# Altium schematic sheet 01_Alimentacion.SchDoc
size A; SheetNumber: 1; SheetTotal: 4
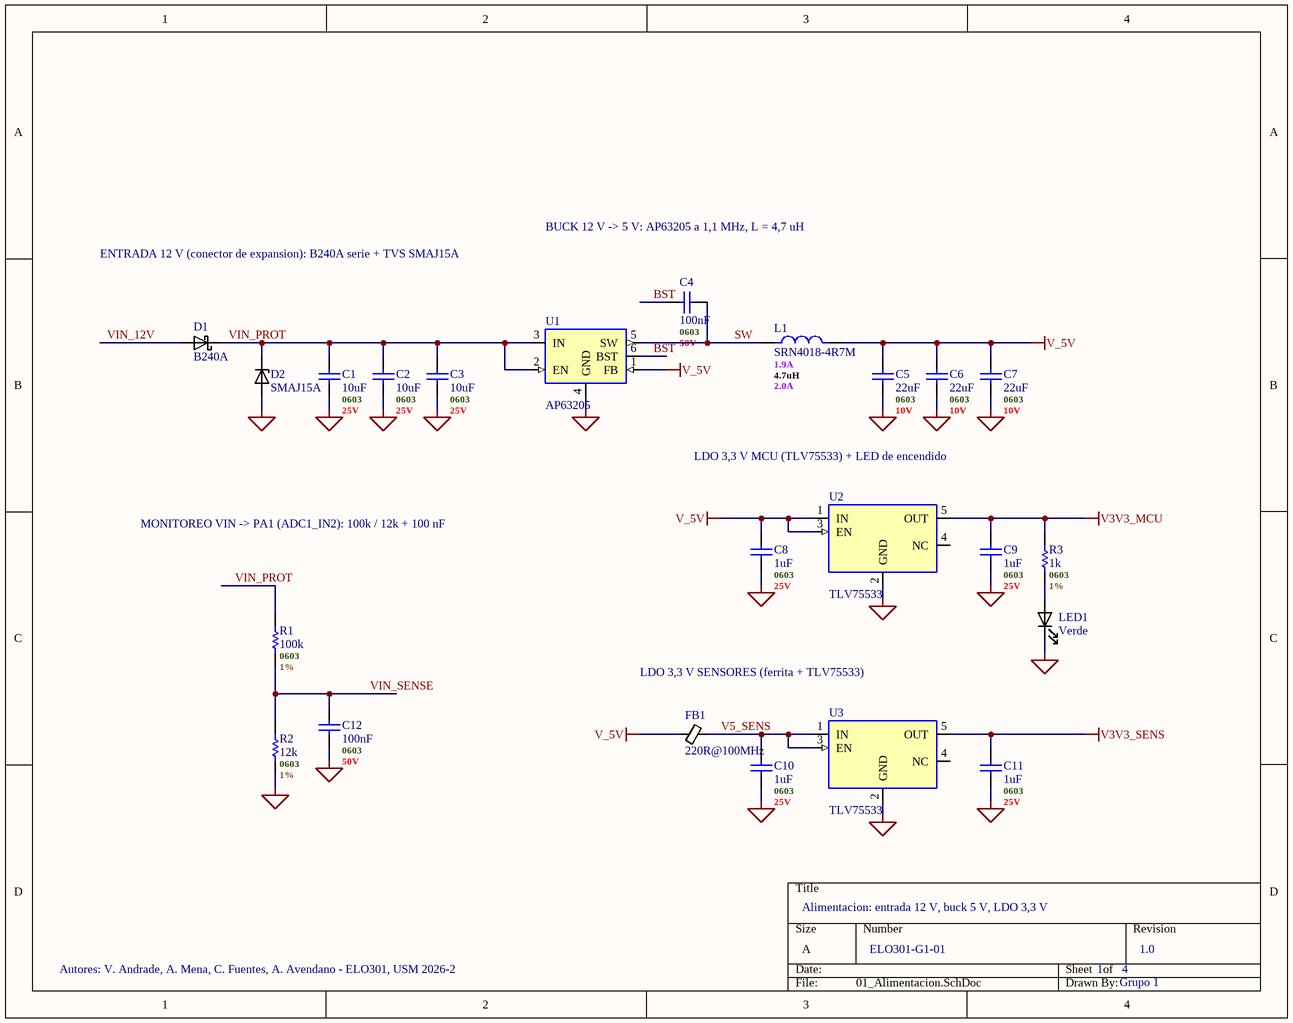
[diagram p0: 01_Alimentacion.SchDoc]

## Parts
C1  10uF  .Case/Package: 0603  .Voltage Rating (DC): 25V  [C0603 - MURATA]
C2  10uF  .Case/Package: 0603  .Voltage Rating (DC): 25V  [C0603 - MURATA]
C3  10uF  .Case/Package: 0603  .Voltage Rating (DC): 25V  [C0603 - MURATA]
C4  100nF  .Case/Package: 0603  .Voltage Rating (DC): 50V  [C0603 - MURATA]
C5  22uF  .Case/Package: 0603  .Voltage Rating (DC): 10V  [C0603 - MURATA]
C6  22uF  .Case/Package: 0603  .Voltage Rating (DC): 10V  [C0603 - MURATA]
C7  22uF  .Case/Package: 0603  .Voltage Rating (DC): 10V  [C0603 - MURATA]
C8  1uF  .Case/Package: 0603  .Voltage Rating (DC): 25V  [C0603 - MURATA]
C9  1uF  .Case/Package: 0603  .Voltage Rating (DC): 25V  [C0603 - MURATA]
C10  1uF  .Case/Package: 0603  .Voltage Rating (DC): 25V  [C0603 - MURATA]
C11  1uF  .Case/Package: 0603  .Voltage Rating (DC): 25V  [C0603 - MURATA]
C12  100nF  .Case/Package: 0603  .Voltage Rating (DC): 50V  [C0603 - MURATA]
D1  B240A  [SMA - DIODES]
D2  SMAJ15A  [SMA - DIODES]
FB1  220R@100MHz  [L0603 - GENERIC]
L1  SRN4018-4R7M  .RMS Current (Irms): 1.9A  .Value: 4.7uH  .Max DC Current: 2.0A  [SRN4018 - BOURNS]
LED1  Verde  [LED0603 - LITEON]
R1  100k  .Case/Package: 0603  .Tolerance: 1%  [R0603 - YAGEO]
R2  12k  .Case/Package: 0603  .Tolerance: 1%  [R0603 - YAGEO]
R3  1k  .Case/Package: 0603  .Tolerance: 1%  [R0603 - YAGEO]
U1  AP63205  [TSOT-23-6 - DIODES]
U2  TLV75533  [SOT-23-5 - TI]
U3  TLV75533  [SOT-23-5 - TI]

## Nets
GND: C1.2 C2.2 C3.2 C5.2 C6.2 C7.2 C8.2 C9.2 C10.2 C11.2 C12.2 D2.2(A) LED1.1(K) R2.1 U1.4(GND) U2.2(GND) U3.2(GND)
V3V3_MCU: C9.1 R3.2 U2.5(OUT)
V3V3_SENS: C11.1 U3.5(OUT)
V_5V: C5.1 C6.1 C7.1 C8.1 FB1.1 L1.2 U1.1(FB) U2.1(IN) U2.3(EN)
BST: C4.1 U1.6(BST)
SW: C4.2 L1.1 U1.5(SW)
V5_SENS: C10.1 FB1.2 U3.1(IN) U3.3(EN)
VIN_12V: D1.2(A)
VIN_PROT: C1.1 C2.1 C3.1 D1.1(K) D2.1(K) R1.2 U1.2(EN) U1.3(IN)
VIN_SENSE: C12.1 R1.1 R2.2
NetLED1_2: LED1.2(A) R3.1

Not connected (* = marked no-connect by the designer): U2 4(NC); U3 4(NC)

## Notes on the sheet
- BUCK 12 V -> 5 V: AP63205 a 1,1 MHz, L = 4,7 uH
- ENTRADA 12 V (conector de expansion): B240A serie + TVS SMAJ15A
- LDO 3,3 V MCU (TLV75533) + LED de encendido
- MONITOREO VIN -> PA1 (ADC1_IN2): 100k / 12k + 100 nF
- LDO 3,3 V SENSORES (ferrita + TLV75533)
- Alimentacion: entrada 12 V, buck 5 V, LDO 3,3 V
- Autores: V. Andrade, A. Mena, C. Fuentes, A. Avendano - ELO301, USM 2026-2
- ELO301-G1-01
- 1
- 4
- 1.0
- Grupo 1

## Library data of the parts
C1-C3 = CAP - GENERIC: 10 µF ±20% 25V Ceramic Capacitor X5R 0603 (1608 Metric); Manufacturer: Murata Electronics; Manufacturer Part Number: GRM188R61E106MA73D; Case/Package: 0603; Voltage Rating (DC): 25V; Supplier 1: DigiKey; Supplier Part Number 1: 490-7202-1-ND; Supplier 2: LCSC; Supplier Part Number 2: C91606; Category: Ceramic Capacitors; Operating Temperature: -55°C ~ 85°C; Lifecycle Status: Active; ComponentLink1Description: Datasheet; ComponentLink1URL: https://mm.digikey.com/Volume0/opasdata/d220001/medias/docus/8942/Chip_Multilayer_CAT2021_MLCC.pdf; ComponentLink2Description: DigiKey; ComponentLink2URL: https://www.digikey.com/en/products/result?keywords=GRM188R61E106MA73D
C4 C12 = CAP - GENERIC: 0.1 µF ±10% 50V Ceramic Capacitor X7R 0603 (1608 Metric); Manufacturer: Murata Electronics; Manufacturer Part Number: GCM188R71H104KA57D; Case/Package: 0603; Voltage Rating (DC): 50V; Supplier 1: DigiKey; Supplier Part Number 1: 490-4779-1-ND; Category: Ceramic Capacitors; Operating Temperature: -55°C ~ 125°C; Lifecycle Status: Active; ComponentLink1Description: Datasheet; ComponentLink1URL: https://pim.murata.com/asset/pim4/ceramicCapacitorSMD/GCM188R71H104KA57-01A-EN_PDF_CERAMICCAPACITORSMD; ComponentLink2Description: DigiKey; ComponentLink2URL: https://www.digikey.com/en/products/result?keywords=GCM188R71H104KA57D
C5-C7 = CAP - GENERIC: 22 µF ±20% 10V Ceramic Capacitor X5R 0603 (1608 Metric); Manufacturer: Murata Electronics; Manufacturer Part Number: GRM188R61A226ME15D; Case/Package: 0603; Voltage Rating (DC): 10V; Supplier 1: DigiKey; Supplier Part Number 1: 490-10476-1-ND; Supplier 2: LCSC; Supplier Part Number 2: C84419; Category: Ceramic Capacitors; Operating Temperature: -55°C ~ 85°C; Lifecycle Status: Active; ComponentLink1Description: Datasheet; ComponentLink1URL: https://mm.digikey.com/Volume0/opasdata/d220001/medias/docus/8942/490_Chip_Multilayer_CAT2021_MLCC.pdf; ComponentLink2Description: DigiKey; ComponentLink2URL: https://www.digikey.com/en/products/result?keywords=GRM188R61A226ME15D
C8-C11 = CAP - GENERIC: 1 µF ±10% 25V Ceramic Capacitor X7R 0603 (1608 Metric); Manufacturer: Murata Electronics; Manufacturer Part Number: GCM188R71E105KA64D; Case/Package: 0603; Voltage Rating (DC): 25V; Supplier 1: DigiKey; Supplier Part Number 1: 490-10673-1-ND; Category: Ceramic Capacitors; Operating Temperature: -55°C ~ 125°C; Lifecycle Status: Active; ComponentLink1Description: Datasheet; ComponentLink1URL: https://pim.murata.com/asset/pim4/ceramicCapacitorSMD/GCM188R71E105KA64-04A-EN_PDF_CERAMICCAPACITORSMD; ComponentLink2Description: DigiKey; ComponentLink2URL: https://www.digikey.com/en/products/result?keywords=GCM188R71E105KA64D
D1 = B240A-13-F: Schottky Diode 40 V 2A Surface Mount SMA; Manufacturer: Diodes Incorporated; Manufacturer Part Number: B240A-13-F; Supplier 1: DigiKey; Supplier Part Number 1: B240A-FDICT-ND; Supplier 2: LCSC; Supplier Part Number 2: C92506; Category: Single Diodes; Case/Package: DO-214AC, SMA; Supplier Device Package: SMA; Operating Temperature: -65°C ~ 150°C; Lifecycle Status: Active; ComponentLink1Description: Datasheet; ComponentLink1URL: https://www.diodes.com/assets/Datasheets/B220_A-B260_A.pdf; ComponentLink2Description: DigiKey; ComponentLink2URL: https://www.digikey.com/en/products/result?keywords=B240A-13-F
D2 = SMAJ15A-13-F: 24.4V Clamp 16.4A Ipp Tvs Diode Surface Mount SMA; Manufacturer: Diodes Incorporated; Manufacturer Part Number: SMAJ15A-13-F; Supplier 1: DigiKey; Supplier Part Number 1: SMAJ15A-FDICT-ND; Supplier 2: LCSC; Supplier Part Number 2: C110520; Category: TVS Diodes; Case/Package: DO-214AC, SMA; Supplier Device Package: SMA; Operating Temperature: -55°C ~ 150°C (TJ); Lifecycle Status: Active; ComponentLink1Description: Datasheet; ComponentLink1URL: https://www.diodes.com/assets/Datasheets/SMAJ5.0CA-SMAJ200CA.pdf; ComponentLink2Description: DigiKey; ComponentLink2URL: https://www.digikey.com/en/products/result?keywords=SMAJ15A-13-F
FB1 = FERRITE - GENERIC: 220 Ohms @ 100 MHz 1 Power Line Ferrite Bead 0603 (1608 Metric) 1.4A 100mOhm; Manufacturer: Murata Electronics; Manufacturer Part Number: BLM18PG221SN1D; Supplier 1: DigiKey; Supplier Part Number 1: 490-5221-1-ND; Supplier 2: LCSC; Supplier Part Number 2: C80165; Category: Ferrite Beads and Chips; Case/Package: 0603 (1608 Metric); Operating Temperature: -55°C ~ 125°C; Lifecycle Status: Active; ComponentLink1Description: Datasheet; ComponentLink1URL: https://pim.murata.com/asset/pim4/ferriteBeadInductortypefilter/ENFA0003_PDF_FERRITEBEADINDUCTORTYPEFILTER; ComponentLink2Description: DigiKey; ComponentLink2URL: https://www.digikey.com/en/products/result?keywords=BLM18PG221SN1D
L1 = INDUCTOR - GENERIC: 4.7 µH Shielded Drum Core, Wirewound Inductor 1.9 A 84mOhm Max Nonstandard; Manufacturer: Bourns Inc.; Value: 4.7uH; Manufacturer Part Number: SRN4018-4R7M; RMS Current (Irms): 1.9A; Max DC Current: 2.0A; Supplier 1: DigiKey; Supplier Part Number 1: SRN4018-4R7MCT-ND; Supplier 2: LCSC; Supplier Part Number 2: C780206; Category: Fixed Inductors; Operating Temperature: -40°C ~ 125°C; Lifecycle Status: Active; ComponentLink1Description: Datasheet; ComponentLink1URL: https://www.bourns.com/docs/Product-Datasheets/SRN4018.pdf; ComponentLink2Description: DigiKey; ComponentLink2URL: https://www.digikey.com/en/products/result?keywords=SRN4018-4R7M
LED1 = LED - GENERIC: Green 571nm LED Indication - Discrete 2V 0603 (1608 Metric); Manufacturer: Lite-On Inc.; Manufacturer Part Number: LTST-C191KGKT; Supplier 1: DigiKey; Supplier Part Number 1: 160-1446-1-ND; Supplier 2: LCSC; Supplier Part Number 2: C125098; Category: LED Indication - Discrete; Case/Package: 0603 (1608 Metric); Lifecycle Status: Active; ComponentLink1Description: Datasheet; ComponentLink1URL: https://optoelectronics.liteon.com/upload/download/DS22-2000-228/LTST-C191KGKT.PDF; ComponentLink2Description: DigiKey; ComponentLink2URL: https://www.digikey.com/en/products/result?keywords=LTST-C191KGKT
R1 = RESISTOR - GENERIC: 100 kOhms ±1% 0.1W, 1/10W Chip Resistor 0603 (1608 Metric) Moisture Resistant Thick Film; Manufacturer: YAGEO; Manufacturer Part Number: RC0603FR-07100KL; Case/Package: 0603; Tolerance: 1%; Supplier 1: DigiKey; Supplier Part Number 1: 311-100KHRCT-ND; Supplier 2: LCSC; Supplier Part Number 2: C14675; Category: Chip Resistor - Surface Mount; Operating Temperature: -55°C ~ 155°C; Lifecycle Status: Active; ComponentLink1Description: Datasheet; ComponentLink1URL: https://yageogroup.com/content/datasheet/asset/file/PYU-RC_GROUP_51_ROHS_L; ComponentLink2Description: DigiKey; ComponentLink2URL: https://www.digikey.com/en/products/result?keywords=RC0603FR-07100KL
R2 = RESISTOR - GENERIC: 12 kOhms ±1% 0.1W, 1/10W Chip Resistor 0603 (1608 Metric) Moisture Resistant Thick Film; Manufacturer: YAGEO; Manufacturer Part Number: RC0603FR-0712KL; Case/Package: 0603; Tolerance: 1%; Supplier 1: DigiKey; Supplier Part Number 1: 311-12.0KHRCT-ND; Supplier 2: LCSC; Supplier Part Number 2: C114659; Category: Chip Resistor - Surface Mount; Operating Temperature: -55°C ~ 155°C; Lifecycle Status: Active; ComponentLink1Description: Datasheet; ComponentLink1URL: https://yageogroup.com/content/datasheet/asset/file/PYU-RC_GROUP_51_ROHS_L; ComponentLink2Description: DigiKey; ComponentLink2URL: https://www.digikey.com/en/products/result?keywords=RC0603FR-0712KL
R3 = RESISTOR - GENERIC: 1 kOhms ±1% 0.1W, 1/10W Chip Resistor 0603 (1608 Metric) Moisture Resistant Thick Film; Manufacturer: YAGEO; Manufacturer Part Number: RC0603FR-071KL; Case/Package: 0603; Tolerance: 1%; Supplier 1: DigiKey; Supplier Part Number 1: 311-1.00KHRCT-ND; Supplier 2: LCSC; Supplier Part Number 2: C22548; Category: Chip Resistor - Surface Mount; Operating Temperature: -55°C ~ 155°C; Lifecycle Status: Active; ComponentLink1Description: Datasheet; ComponentLink1URL: https://yageogroup.com/content/datasheet/asset/file/PYU-RC_GROUP_51_ROHS_L; ComponentLink2Description: DigiKey; ComponentLink2URL: https://www.digikey.com/en/products/result?keywords=RC0603FR-071KL
U1 = AP63205WU-7: Buck Switching Regulator IC Positive Fixed 5V 1 Output 2A SOT-23-6 Thin, TSOT-23-6; Manufacturer: Diodes Incorporated; Manufacturer Part Number: AP63205WU-7; Supplier 1: DigiKey; Supplier Part Number 1: AP63205WU-7DICT-ND; Supplier 2: LCSC; Supplier Part Number 2: C2071056; Category: Voltage Regulators - DC DC Switching Regulators; Case/Package: SOT-23-6 Thin, TSOT-23-6; Supplier Device Package: TSOT-23-6; Operating Temperature: -40°C ~ 85°C (TA); Lifecycle Status: Active; ComponentLink1Description: Datasheet; ComponentLink1URL: https://www.diodes.com/assets/Datasheets/AP63200-AP63201-AP63203-AP63205.pdf; ComponentLink2Description: DigiKey; ComponentLink2URL: https://www.digikey.com/en/products/result?keywords=AP63205WU-7
U2 U3 = TLV75533PDBVR: Linear Voltage Regulator IC Positive Fixed 1 Output 500mA SOT-23-5; Manufacturer: Texas Instruments; Manufacturer Part Number: TLV75533PDBVR; Supplier 1: DigiKey; Supplier Part Number 1: 296-50411-1-ND; Supplier 2: LCSC; Supplier Part Number 2: C404027; Category: Voltage Regulators - Linear, Low Drop Out (LDO) Regulators; Case/Package: SC-74A, SOT-753; Supplier Device Package: SOT-23-5; Operating Temperature: -40°C ~ 125°C (TJ); Lifecycle Status: Active; ComponentLink1Description: Datasheet; ComponentLink1URL: https://www.ti.com/lit/ds/symlink/tlv755p.pdf; ComponentLink2Description: DigiKey; ComponentLink2URL: https://www.digikey.com/en/products/result?keywords=TLV75533PDBVR